# Altium project Main_board4.PrjPcb
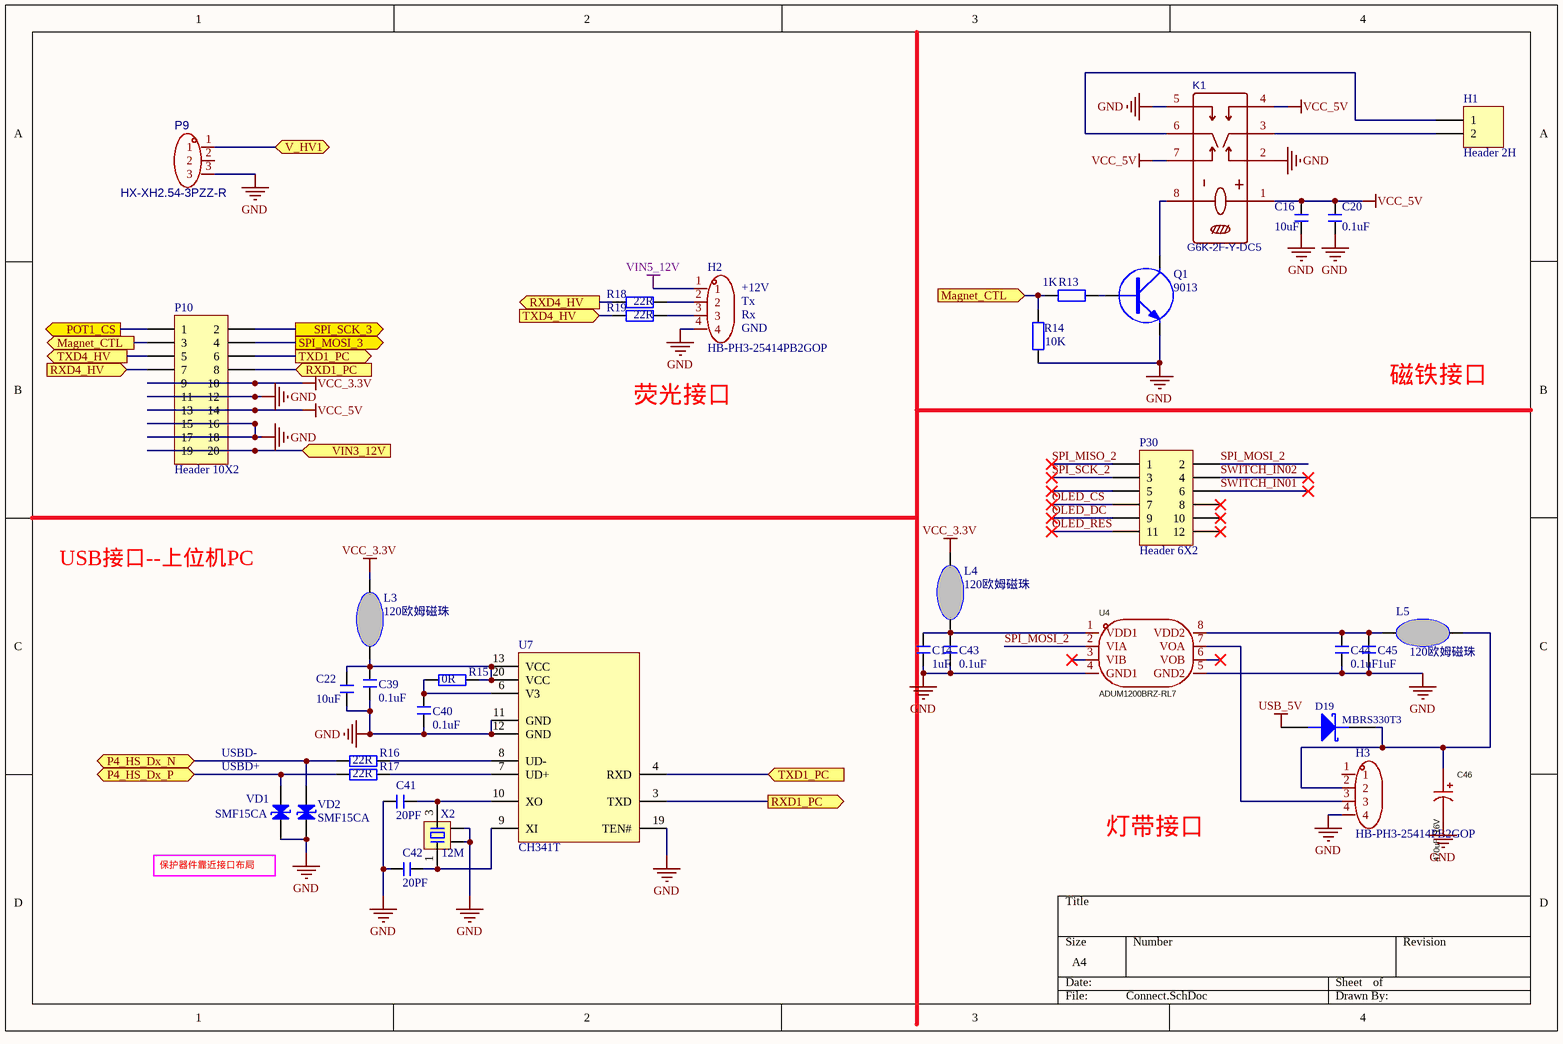
[diagram p0: Connect.SchDoc]
3 sheets, 176 parts. Net scope: flat (ports and power ports of the same name join across sheets).
Board file: BD4_dy_V1.0.PcbDoc
Sheets:
  Connect.SchDoc
  Power.SchDoc
  USBhub-CH634M-R0-1v1.SchDoc

## Sheet Connect.SchDoc
size A4

### Parts
(Parts that share a designator on the sheet are numbered #1, #2 ... from top to bottom, then left to right.)
C14  1uF  [C 0603]
C16#1  10uF  [C 0805]
C20#1  0.1uF  [C 0603]
C22#1  10uF  [C 0805]
C39  0.1uF  [C 0603]
C40  0.1uF  [C 0603]
C41  20PF  [C 0603]
C42  20PF  [C 0603]
C43  0.1uF  [C 0603]
C44  0.1uF  [C 0603]
C45  1uF  [C 0603]
C46  470uF /16V  [CAP-TH_BD8.0-P3.50-D0.6-FD]
D19  MBRS330T3  [MBRS340]
H1  Header 2H  [CONN-TH_2P-P2.54_ZX-XH2.54-2PZZ-Y]
H2  HB-PH3-25414PB2GOP  [CONN-TH_4P-P2.50_ZX-XH2.54-4PZZ-Y]
H3  HB-PH3-25414PB2GOP  [CONN-TH_4P-P2.50_ZX-XH2.54-4PZZ-Y]
K1  G6K-2F-Y-DC5  [RELAY-SMD_G6K-2F-Y]
L3  120欧姆磁珠  [L 0603]
L4  120欧姆磁珠  [L 0603]
L5  120欧姆磁珠  [L 0603]
P9  HX-XH2.54-3PZZ-R  [CONN-TH_3P-P2.50_HX-XH2.54-3PZZ-B]
P10  Header 10X2  [HDR-10X2]
P30  Header 6X2  [HDR-6X2]
Q1  9013  [SOT23]
R13  1K  [R 0603]
R14  10K  [R 0603]
R15  0R  [R 0603]
R16  22R  [R 0603]
R17  22R  [R 0603]
R18  22R  [R 0603]
R19  22R  [R 0603]
U4  ADUM1200BRZ-RL7  [SOIC-8_L4.9-W3.9-P1.27-LS6.0-BL]
U7  CH341T  [SSOP-20]
VD1  SMF15CA  [SOD-123F]
VD2  SMF15CA  [SOD-123F]
X2  12M  [XTAL-3225]

### Ports
Magnet_CTL (in), Magnet_CTL (out), P4_HS_Dx_N (bidir), P4_HS_Dx_P (bidir), POT1_CS (out), RXD1_PC (in), RXD1_PC (out), RXD4_HV (in), RXD4_HV (out), SPI_MOSI_3 (out), SPI_SCK_3 (out), TXD1_PC (in), TXD1_PC (out), TXD4_HV (in), TXD4_HV (out), V_HV1, VIN3_12V (in)

### Nets
GND: C14.2 C16#1.1 C20#1.1 C22#1.1 C39.1 C40.1 C41.2 C42.2 C43.2 C44.2 C45.2 C46.2 H2.4 H3.4 K1.2 K1.5 P9.3 P10.11 P10.12 P10.15 P10.16 P10.17 P10.18 Q1.2 R14.2 U4.4(GND1) U4.5(GND2) U7.11(GND) U7.12(GND) U7.19(TEN#) VD1.2(K) VD2.2(K) X2.2 X2.4
USB_5V: D19.1(A)
VCC_3.3V: L3.1 L4.1 P10.9 P10.10
VCC_5V: C16#1.2 C20#1.2 K1.1 K1.4 K1.7 P10.13 P10.14
VIN5_12V: H2.1
OLED_CS: P30.7
OLED_DC: P30.9
OLED_RES: P30.11
P4_AS_DX_N: R16.2 VD2.1(A) ; port P4_HS_Dx_N
P4_AS_DX_P: R17.2 VD1.1(A) ; port P4_HS_Dx_P
SPI_MISO_2: P30.1
SPI_MOSI_2: P30.2 U4.2(VIA)
SPI_SCK_2: P30.3
SWITCH_IN01: P30.6
SWITCH_IN02: P30.4
NetC14_1: C14.1 C43.1 L4.2 U4.1(VDD1)
NetC22#1_2: C22#1.2 C39.2 L3.2 R15.1 U7.13(VCC) U7.20(VCC)
NetC40_2: C40.2 R15.2 U7.6(V3)
NetC41_1: C41.1 U7.10(XO) X2.3
NetC42_1: C42.1 U7.9(XI) X2.1
NetC44_1: C44.1 C45.1 L5.1 U4.8(VDD2)
NetC46_1: C46.1 D19.2(K) H3.2 L5.2
NetC76_1: P9.1 ; port V_HV1
NetD8_1: P10.19 P10.20 ; port VIN3_12V
NetH1_1: H1.1 K1.6
NetH1_2: H1.2 K1.3
NetH2_2: H2.2 R18.1
NetH2_3: H2.3 R19.1
NetH3_3: H3.3 U4.7(VOA)
NetK1_8: K1.8 Q1.3
NetP10_1: P10.1 ; port POT1_CS
NetP10_2: P10.2 ; port SPI_SCK_3
NetP10_3: P10.3 R13.1 R14.1 ; port Magnet_CTL
NetP10_4: P10.4 ; port SPI_MOSI_3
NetP10_5: P10.5 R19.2 ; port TXD4_HV
NetP10_6: P10.6 U7.4(RXD) ; port TXD1_PC
NetP10_7: P10.7 R18.2 ; port RXD4_HV
NetP10_8: P10.8 U7.3(TXD) ; port RXD1_PC
NetQ1_1: Q1.1 R13.2
NetR16_1: R16.1 U7.8(UD-)
NetR17_1: R17.1 U7.7(UD+)

Not connected (* = marked no-connect by the designer): H3 1; P9 2; P30 5* 8* 10* 12*; U4 3(VIB)* 6(VOB)*

### Notes on the sheet
- (near H2) Tx
- (near H2) +12V
- (near H2) Rx
- (near H2) GND
- 磁铁接口
- 荧光接口
- USB接口--上位机PC
- USBD-
- USBD+
- 灯带接口
- 保护器件靠近接口布局
- (in symbol C-CAP) +

### Library data of the parts
C14 C16#1 C20#1 C43-C45 = C-CC: 直插瓷片电容; 版权归属: 源创客; BOM名称: 直插瓷片电容; 学习资源: www.ooocke.com
C22#1 C39-C42 = C: 无极性贴片电容; 版权归属: 源创客; BOM名称: 无极性贴片电容; 学习资源: www.ooocke.com
C46 = JBLE2471M016D090RLM 470UF 16V: Add into BOM: yes; Rated Voltage: 16V; Ripple Current: 3.7A@100kHz; Symbol: JBLE2471M016D090RLM 470UF 16V; Device: JBLE2471M016D090RLM 470UF 16V; Supplier Part: C19270650; Manufacturer Part: JBLE2471M016D090RLM 470UF 16V; JLCPCB Part Class: Extended Part; Datasheet: https://atta.szlcsc.com/upload/public/pdf/source/20240115/1E5B34C3EFC94403EAAAB66897201DA6.pdf; Supplier: LCSC; Convert to PCB: yes; Value: 470uF
D19 = DIODE SCHOTTKY: Schottky Diode
H1 = Header 2H: Header, 2-Pin, Right Angle; LatestRevisionDate: 17-Jul-2002; LatestRevisionNote: Re-released for DXP Platform.; Publisher: Altium Limited
H2 H3 = HB-PH3-25414PB2GOP: Add into BOM: yes; Pin Structure: 1x4P; Pitch: 2.54mm; Current Rating (Max): 3A; Voltage Rating (Max): 250V; Symbol: HB-PH3-25414PB2GOP; Device: HB-PH3-25414PB2GOP; Supplier Part: C6332197; Manufacturer Part: HB-PH3-25414PB2GOP; Datasheet: https://atta.szlcsc.com/upload/public/pdf/source/20230803/F72D259687963761DF1B552F3BB84A31.pdf; Supplier: LCSC; Convert to PCB: yes; Row Spacing: 2.54mm; Number of Pins: 4P; Length of Mating Pin: 6mm; Insulation Height: 2.54mm; Length of End Connection Pin: 3mm; Comment_1: HB-PH3-25414PB2GOP
K1 = G6K-2F-Y-DC12: BOM_Manufacturer: Omron Electronics; Contributor: LCSC; BOM_Supplier: LCSC; BOM_Supplier Part: C397194; BOM_Manufacturer Part: G6K-2F-Y-DC12; BOM_JLCPCB Part Class: Extended Part; spicePre: K; spiceSymbolName: G6K-2F-Y-DC12
L3-L5 = FERRITBEAD
P9 = HX-XH2.54-3PZZ-R: AddInBom: yes; Pins Structure: 1x3P; Pitch: 2.54mm; Reference Series: XH; Number of PINs Per Row: 3; Current Rating: 3A; Voltage Rating: 250V; Plastic Material: PA66; Flame Retardant Rating: UL94V-0; Symbol: HX-XH2.54-3PZZ-R; Device: HX-XH2.54-3PZZ-R; SupplierPart: C49010011; ManufacturerPart: HX-XH2.54-3PZZ-R; JLCPCB Part Class: Extended Part; Datasheet: https://item.szlcsc.com/datasheet/HX-XH2.54-3PZZ-R/51365932.html; Supplier: LCSC; ConvertToPcb: yes; FootprintName: CONN-TH_3P-P2.50_HX-XH2.54-3PZZ-B; Number of Pins: 3P; Number of Rows: 1; Row Spacing: -; Supplementary Features: -; Z-Height of the Board: -; X-Length of Bottom Edge on Board (Spacing Line): -; Y-Width of Bottom Edge on Board: -
P10 = Header 10X2: Header, 10-Pin, Dual row; LatestRevisionDate: 17-Jul-2002; LatestRevisionNote: Re-released for DXP Platform.; Publisher: Altium Limited
P30 = Header 6X2: Header, 6-Pin, Dual row; LatestRevisionDate: 17-Jul-2002; LatestRevisionNote: Re-released for DXP Platform.; Publisher: Altium Limited
Q1 = 2N2222: value: 9013
R13 R14 = Res2: Resistor; Published: 8-Jun-2000; LatestRevisionDate: 17-Jul-2002; LatestRevisionNote: Re-released for DXP Platform.; PackageReference: AXIAL-0.4; Publisher: Altium Limited
  R13: Value: 1K
  R14: Value: 10K
R15-R19 = R: 贴片电阻; 版权归属: 源创客; BOM名称: 贴片电阻; 学习资源: www.ooocke.com
U4 = ADUM1200BRZ-RL7: Add into BOM: yes; Number of Forward Channels: 2; Number of Reverse Channels: 0; Data Rate(Max): 25Mbps; Isolation Voltage(Vrms): 2500; CMTI(kV/us): 25kV/us; Symbol: ADUM1200BRZ; Device: ADUM1200BRZ-RL7; Supplier Part: C30230; Manufacturer Part: ADUM1200BRZ-RL7; Supplier Footprint: SOIC-8; JLCPCB Part Class: Extended Part; Datasheet: https://atta.szlcsc.com/upload/public/pdf/source/20140418/1457707045216.pdf; Supplier: LCSC; Convert to PCB: yes; Default Output: -; Rating: -; Comment_1: ADUM1200BRZ-RL7
VD1 VD2 = DR: 瞬态电压抑制二极管; 版权归属: 源创客; BOM名称: 瞬态电压抑制二极管; 学习资源: www.ooocke.com
X2 = XTAL-4: 4脚晶振; 版权归属: 源创客; BOM名称: 4脚晶振; 学习资源: www.ooocke.com

## Sheet Power.SchDoc
size A3
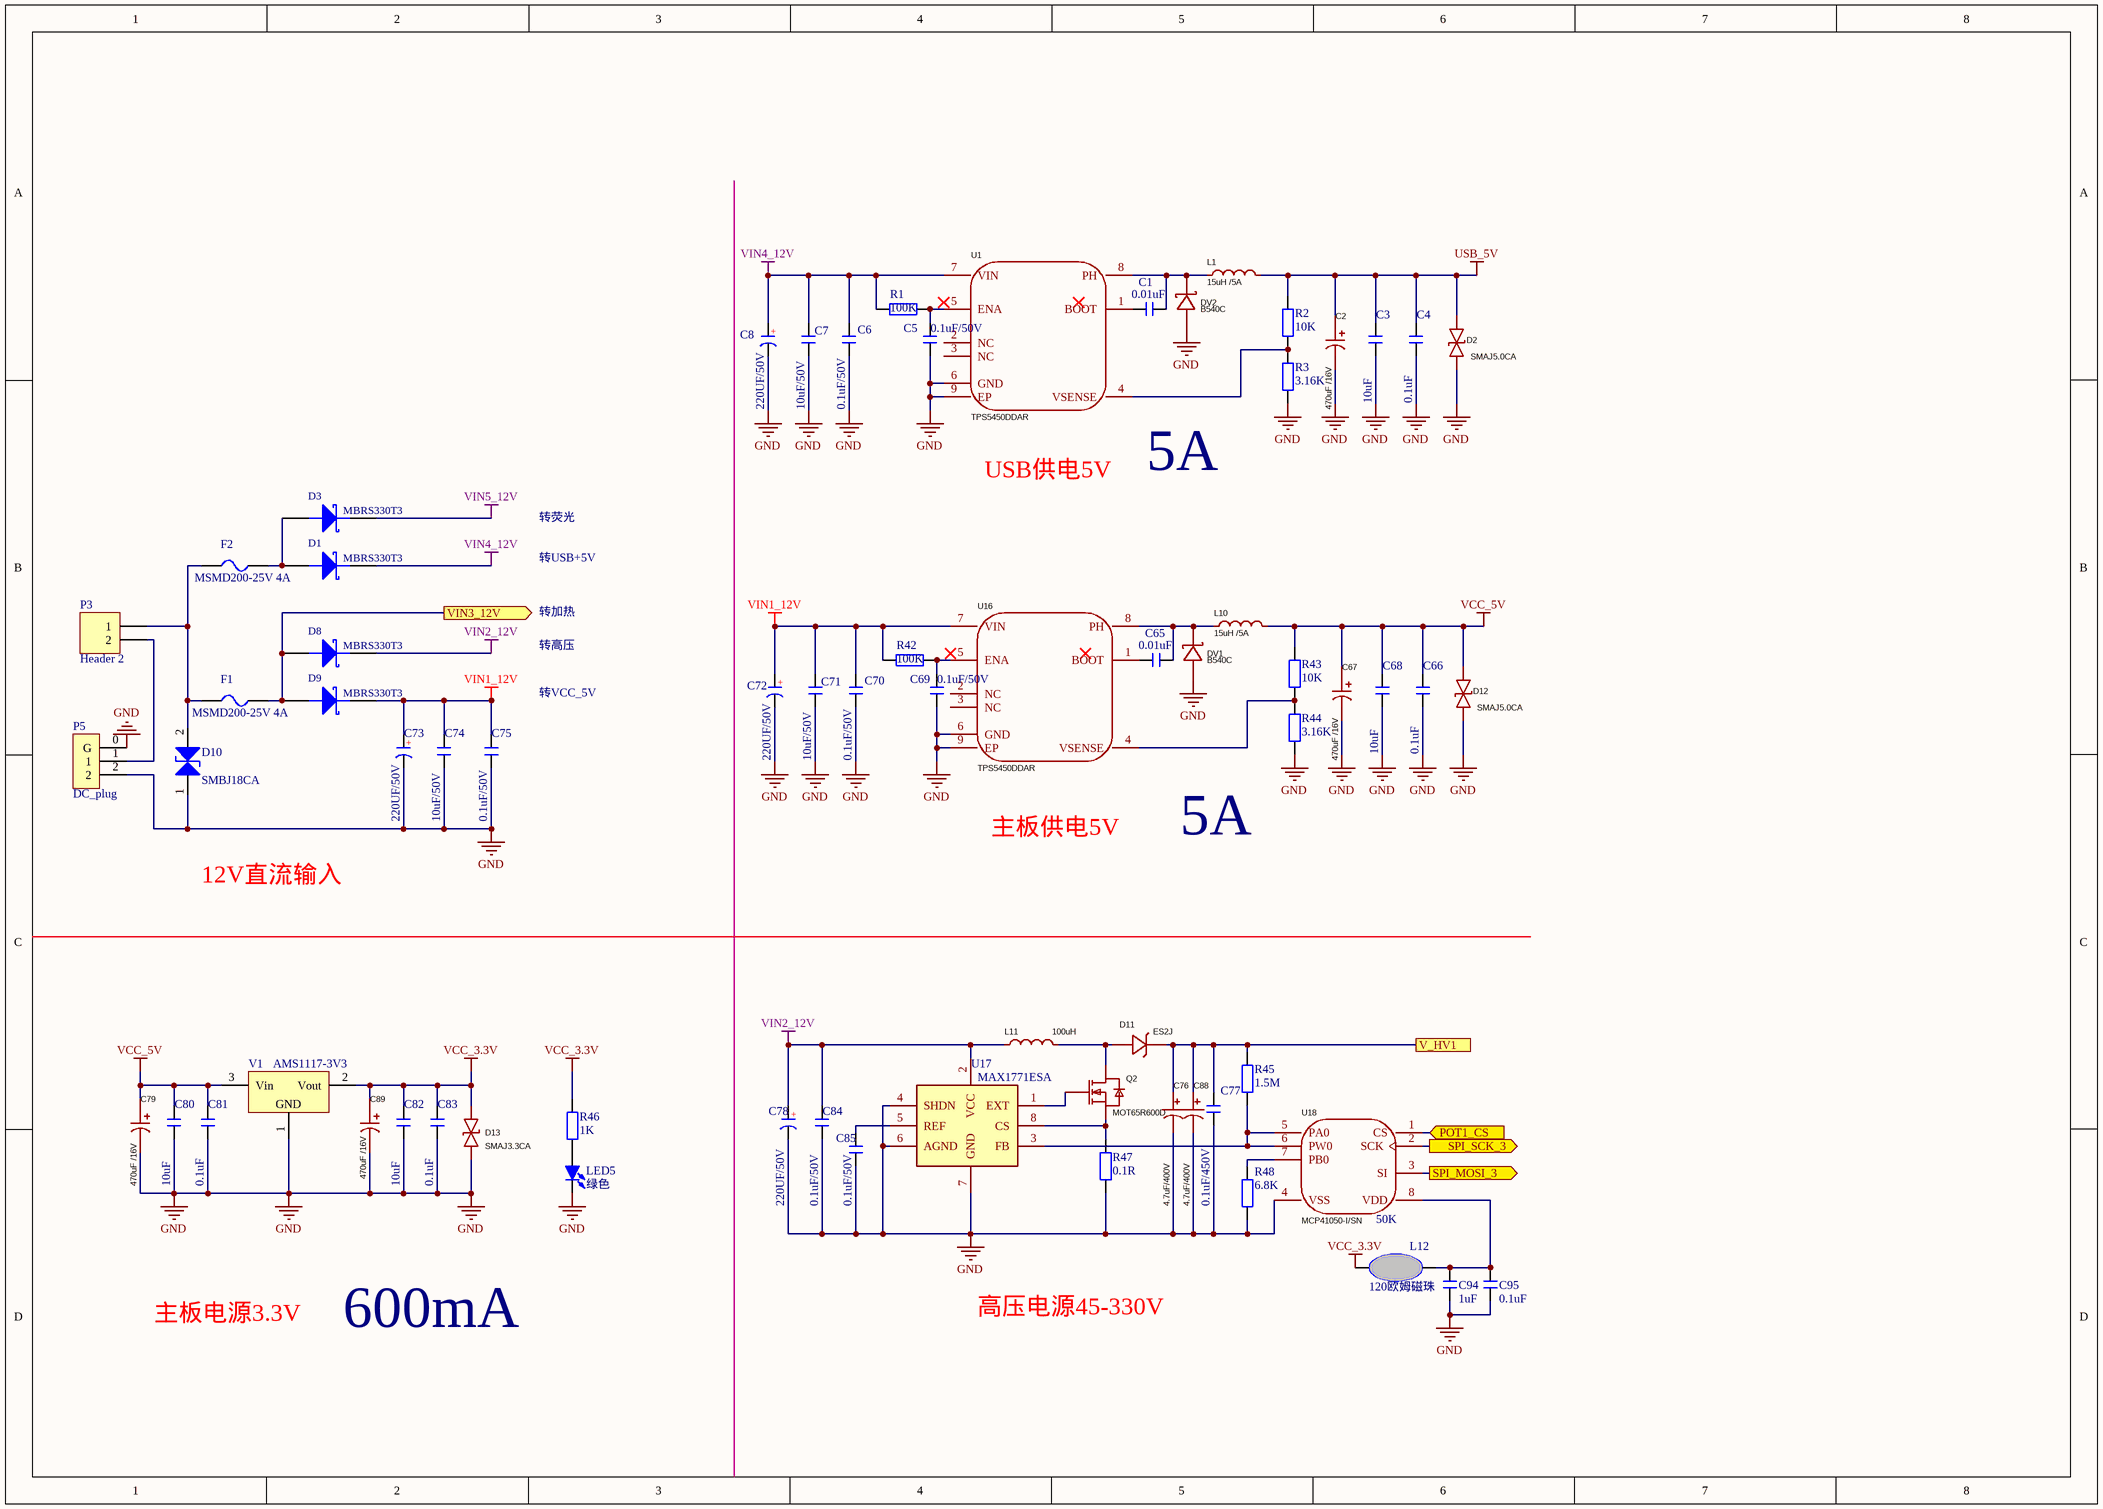
[diagram p1: Power.SchDoc]

### Parts
(Parts that share a designator on the sheet are numbered #1, #2 ... from top to bottom, then left to right.)
C1  0.01uF  [C 1206]
C2  470uF /16V  [CAP-TH_BD8.0-P3.50-D0.6-FD]
C3  10uF  [C 0805]
C4  0.1uF  [C 0603]
C5  0.1uF/50V  [C 1206]
C6  0.1uF/50V  [C 1206]
C7  10uF/50V  [C 1206]
C8  220UF/50V  [CAP 5.0*10*12.5]
C65  0.01uF  [C 1206]
C66  0.1uF  [C 0603]
C67  470uF /16V  [CAP-TH_BD8.0-P3.50-D0.6-FD]
C68  10uF  [C 0805]
C69  0.1uF/50V  [C 1206]
C70  0.1uF/50V  [C 1206]
C71  10uF/50V  [C 1206]
C72  220UF/50V  [CAP 5.0*10*12.5]
C73  220UF/50V  [CAP 5.0*10*12.5]
C74  10uF/50V  [C 1206]
C75  0.1uF/50V  [C 1206]
C76  4.7uF/400V  [CAP-TH_BD8.0-P3.50-D0.6-FD]
C77  0.1uF/450V  [C 1206]
C78  220UF/50V  [CAP 5.0*10*12.5]
C79  470uF /16V  [CAP-TH_BD8.0-P3.50-D0.6-FD]
C80  10uF  [C 0805]
C81  0.1uF  [C 0603]
C82  10uF  [C 0805]
C83  0.1uF  [C 0603]
C84  0.1uF/50V  [C 1206]
C85  0.1uF/50V  [C 1206]
C88  4.7uF/400V  [CAP-TH_BD8.0-P3.50-D0.6-FD]
C89  470uF /16V  [CAP-TH_BD8.0-P3.50-D0.6-FD]
C94  1uF  [C 0603]
C95  0.1uF  [C 0603]
D1  MBRS330T3  [MBRS340]
D2  SMAJ5.0CA  [SMA_L4.4-W2.6-LS5.0-BI]
D3  MBRS330T3  [MBRS340]
D8  MBRS330T3  [MBRS340]
D9  MBRS330T3  [MBRS340]
D10  SMBJ18CA  [SMB]
D11  ES2J  [SMB_L4.4-W3.6-LS5.4-RD]
D12  SMAJ5.0CA  [SMA_L4.4-W2.6-LS5.0-BI]
D13  SMAJ3.3CA  [SMA_L4.4-W2.6-LS5.0-BI]
DV1  B540C  [SMC_L7.1-W6.2-LS8.1-RD]
DV2  B540C  [SMC_L7.1-W6.2-LS8.1-RD]
F1  MSMD200-25V 4A  [FU 1812]
F2  MSMD200-25V 4A  [FU 1812]
L1  15uH /5A  [IND-SMD_L8.5-W8.0_PCC-M0854M]
L10  15uH /5A  [IND-SMD_L8.5-W8.0_PCC-M0854M]
L11  100uH  [IND-SMD_L18.3-W17.0]
L12  120欧姆磁珠  [L 0603]
LED5  绿色  [LED 0603G]
P3#1  Header 2  [SIP2-3.5mm]
P5  DC_plug  [POWERPLUG_slc]
Q2  MOT65R600D  [TO-252-3_L6.6-W6.1-P4.58-LS10.1-BR-1]
R1  100K  [R 0603]
R2#1  10K  [R 0603]
R3#1  3.16K  [R 0603]
R42  100K  [R 0603]
R43  10K  [R 0603]
R44  3.16K  [R 0603]
R45  1.5M  [RES-TH_BD2.4-L6.3-P10.30-D0.6]
R46  1K  [R 0603]
R47  0.1R  [R 1812]
R48  6.8K  [R 0603]
U1  TPS5450DDAR  [SOP-8_L4.9-W3.9-P1.27-LS6.0-BL-EP]
U16  TPS5450DDAR  [SOP-8_L4.9-W3.9-P1.27-LS6.0-BL-EP]
U17  MAX1771ESA  [SOP8_N]
U18  MCP41050-I/SN  [SOIC-8_L4.9-W3.9-P1.27-LS6.0-BL]
V1  AMS1117-3V3  [SOT223_M]

### Ports
POT1_CS (in), SPI_MOSI_3 (out), SPI_SCK_3 (out), V_HV1, VIN3_12V (out)

### Nets
GND: C2.2 C3.1 C4.1 C5.1 C6.1 C7.1 C8.2 C66.1 C67.2 C68.1 C69.1 C70.1 C71.1 C72.2 C73.2 C74.1 C75.1 C76.2 C77.1 C78.2 C79.2 C80.1 C81.1 C82.1 C83.1 C84.1 C85.1 C88.2 C89.2 C94.2 C95.2 D2.1 D10.1(A) D12.1 D13.1 DV1.2(A) DV2.2(A) LED5.2(K) P5.0(G) P5.2 R3#1.2 R44.2 R47.2 R48.2 U1.6(GND) U1.9(EP) U16.6(GND) U16.9(EP) U17.4(SHDN) U17.6(AGND) U17.7(GND) U18.4(VSS) V1.1(GND)
USB_5V: C2.1 C3.2 C4.2 D2.2 L1.2 R2#1.1
VCC_3.3V: C82.2 C83.2 C89.1 D13.2 L12.1 R46.2 V1.2(Vout)
VCC_5V: C66.2 C67.1 C68.2 C79.1 C80.2 C81.2 D12.2 L10.2 R43.1 V1.3(Vin)
VIN1_12V: C70.2 C71.2 C72.1 C73.1 C74.2 C75.2 D9.2(K) R42.2 U16.7(VIN)
VIN2_12V: C78.1 C84.2 D8.2(K) L11.1 U17.2(VCC)
VIN4_12V: C6.2 C7.2 C8.1 D1.2(K) R1.2 U1.7(VIN)
VIN5_12V: D3.2(K)
NetC1_1: C1.1 DV2.1(K) L1.1 U1.8(PH)
NetC1_2: C1.2 U1.1(BOOT)
NetC5_2: C5.2 R1.1 U1.5(ENA)
NetC65_1: C65.1 DV1.1(K) L10.1 U16.8(PH)
NetC65_2: C65.2 U16.1(BOOT)
NetC69_2: C69.2 R42.1 U16.5(ENA)
NetC76_1: C76.1 C77.2 C88.1 D11.1(C) R45.1 ; port V_HV1
NetC85_2: C85.2 U17.5(REF)
NetC94_1: C94.1 C95.1 L12.2 U18.8(VDD)
NetD1_1: D1.1(A) D3.1(A) F2.2
NetD8_1: D8.1(A) D9.1(A) F1.2 ; port VIN3_12V
NetD10_2: D10.2(K) F1.1 F2.1 P3#1.1
NetD11_2: D11.2(A) L11.2 Q2.2(D)
NetLED5_1: LED5.1(A) R46.1
NetP3#1_2: P3#1.2 P5.1
NetP10_1: U18.1(CS) ; port POT1_CS
NetP10_2: U18.2(SCK) ; port SPI_SCK_3
NetP10_4: U18.3(SI) ; port SPI_MOSI_3
NetQ2_1: Q2.1(G) U17.1(EXT)
NetQ2_3: Q2.3(S) R47.1 U17.8(CS)
NetR2#1_2: R2#1.2 R3#1.1 U1.4(VSENSE)
NetR43_2: R43.2 R44.1 U16.4(VSENSE)
NetR45_2: R45.2 U17.3(FB) U18.5(PA0) U18.6(PW0)
NetR48_1: R48.1 U18.7(PB0)

Not connected (* = marked no-connect by the designer): U1 2(NC) 3(NC); U16 2(NC) 3(NC)

### Notes on the sheet
- USB供电5V
- (near U1) 5A
- 转USB+5V
- 转荧光
- 转高压
- 转加热
- 转VCC_5V
- 主板供电5V
- 5A
- 12V直流输入
- (near U18) 50K
- 主板电源3.3V
- 高压电源45-330V
- 600mA
- (in symbol C-CAP) +

### Library data of the parts
C1 C3-C7 C65 C66 C68-C71 C74 C75 C77 C80 C84 C85 = C: 无极性贴片电容; 版权归属: 源创客; BOM名称: 无极性贴片电容; 学习资源: www.ooocke.com
C2 C67 C79 C89 = JBLE2471M016D090RLM 470UF 16V: as C46 on sheet Connect; Symbol: JBLE2471M016D090RLM 470UF 16V; Device: JBLE2471M016D090RLM 470UF 16V; Supplier Part: C19270650; Manufacturer Part: JBLE2471M016D090RLM 470UF 16V; JLCPCB Part Class: Extended Part; Datasheet: https://atta.szlcsc.com/upload/public/pdf/source/20240115/1E5B34C3EFC94403EAAAB66897201DA6.pdf; Supplier: LCSC; Convert to PCB: yes; Value: 470uF
C8 C72 C73 C78 = C-CAP: 直插电解电容; 版权归属: 源创客; BOM名称: 直插电解电容; 学习资源: www.ooocke.com
C76 C88 = ERK2GM4R7F09OT: Add into BOM: yes; Value: 4.7uF; Rated Voltage: 400V; Ripple Current: 94mA@100kHz; L: 9mm; Symbol: ERK2GM4R7F09OT; Device: ERK2GM4R7F09OT; Supplier Part: C112499; Manufacturer Part: ERK2GM4R7F09OT; JLCPCB Part Class: Extended Part; Datasheet: https://atta.szlcsc.com/upload/public/pdf/source/20200117/C486002_277F2A16EBB2F90C92EEA28887F58F34.pdf; Supplier: LCSC; Convert to PCB: yes; Equivalent Series Resistance(ESR): -; Lead Spacing: 3.5mm
C81-C83 C94 C95 = C-CC: 直插瓷片电容; 版权归属: 源创客; BOM名称: 直插瓷片电容; 学习资源: www.ooocke.com
D1 D3 D8 D9 = DIODE SCHOTTKY: Schottky Diode
D2 D12 = SMAJ5.0CA_C83324: Symbol: SMAJ5.0CA-C83324; Add into BOM: yes; Reverse Stand-Off Voltage (Vrwm): 5V; Maximum Clamping Voltage: 9.2V; Peak Pulse Current (Ipp)@10/1000us: 43.5A; Peak Pulse Power Dissipation (Ppp)@10/1000us: 400W; Breakdown Voltage: 6.4V; Type: TVS; Device: SMAJ5.0CA_C83324; Supplier Part: C83324; Manufacturer Part: SMAJ5.0CA; Supplier Footprint: SMA(DO-214AC); JLCPCB Part Class: Extended Part; Datasheet: https://atta.szlcsc.com/upload/public/pdf/source/20190402/C374025_5ACE77BC72947DF13CF0CBC7F8B57228.pdf; Supplier: LCSC; Convert to PCB: yes
D10 = 1.04.03.0004: SMBJ36CA,DO-214AA,君耀,RoHS; 名称: TVS管; 贴片和直插: SMT; 器件优选方案: 样品物料,谨慎选用; 物料代码: 1.04.03.0004; Value: SMBJ36CA; 封装: SMB; 设备封装名称: SMB; 厂商: 君耀; RoHS: RoHS; 型号: SMBJ18CA; ComponentLink1Description: ErpDataInfo; ComponentLink1URL: http://erp.zlgmcu.com/ErpExt/ErpData/ListMateriel.aspx?pkey=1.04.03.0004
D11 = ES2J_C19078414: Add into BOM: yes; Forward Voltage (Vf@If): 1.65V@2A; Reverse Voltage (Vr): 600V; Rectified Current: 2A; Reverse Leakage Current (Ir): 5uA@600V; Reverse Recovery Time (trr): 35ns; Symbol: ES2J_C19078414; Device: ES2J_C19078414; LCSC Part Name: ES2J; Supplier Part: C19078414; Manufacturer Part: ES2J; Supplier Footprint: SMB; JLCPCB Part Class: Extended Part; Datasheet: https://atta.szlcsc.com/upload/public/pdf/source/20240112/F384E3D3354022DF52BCF808895A4B58.pdf; Supplier: LCSC; Convert to PCB: yes
D13 = SMAJ3.3CA_C2959732: Add into BOM: yes; Reverse Stand-Off Voltage (Vrwm): 3.3V; Maximum Clamping Voltage: 7.3V; Peak Pulse Current (Ipp)@10/1000us: 54.8A; Breakdown Voltage: 4.3V; Reverse Leakage Current (Ir): 200uA; Type: TVS; Symbol: SMAJ3.3CA_C2959732; Device: SMAJ3.3CA_C2959732; Supplier Part: C2959732; Manufacturer Part: SMAJ3.3CA; Supplier Footprint: DO-214AC(SMA); JLCPCB Part Class: Extended Part; Datasheet: https://atta.szlcsc.com/upload/public/pdf/source/20240321/7565B800065238EC693350450D0B602E.pdf; Supplier: LCSC; Convert to PCB: yes
DV1 DV2 = B540C-13-F: Add into BOM: yes; Forward Voltage (Vf@If): 550mV@5A; Reverse Voltage (Vr): 40V; Average Rectified Current (Io): 5A; Reverse Leakage Current (Ir): 500uA@40V; Symbol: B540C-13-F; Device: B540C-13-F; Supplier Part: C72264; Manufacturer Part: B540C-13-F; Supplier Footprint: SMC(DO-214AB); JLCPCB Part Class: Extended Part; Datasheet: https://atta.szlcsc.com/upload/public/pdf/source/20171023/C134461_15087453602301052556.pdf; Supplier: LCSC; Convert to PCB: yes
F1 F2 = FU: 贴片保险丝; 版权归属: 源创客; BOM名称: 贴片保险丝; 学习资源: www.ooocke.com
L1 L10 = PSPMAA0805-150M-ANP: Add into BOM: yes; Rated Current: 5A; Saturation Current (Isat): 9A; Symbol: PSPMAA0805-150M-ANP; Device: PSPMAA0805-150M-ANP; Supplier Part: C2962886; Manufacturer Part: PSPMAA0805-150M-ANP; Supplier Footprint: SMD,8x8.5mm; JLCPCB Part Class: Extended Part; Datasheet: https://atta.szlcsc.com/upload/public/pdf/source/20220120/BD7CDDF36FF1CD7AF8FF4A475B57DD20.pdf; Supplier: LCSC; Convert to PCB: yes; Value: 15uH; Ratings: AEC-Q200
L11 = YSPIA1770-101M: Add into BOM: yes; Rated Current: 3.5A; Saturation Current (Isat): 5A; Symbol: YSPIA1770-101M; Device: YSPIA1770-101M; Supplier Part: C2931812; Manufacturer Part: YSPIA1770-101M; Supplier Footprint: SMD,18.25x17mmx7mm; JLCPCB Part Class: Extended Part; Datasheet: https://atta.szlcsc.com/upload/public/pdf/source/20210615/C2839932_33EF3FE61893DB0D450802CD7C52B644.pdf; Supplier: LCSC; Convert to PCB: yes; Value: 100uH; Ratings: -
L12 = FERRITBEAD
LED5 = LED-SMD: 贴片LED; 版权归属: 源创客; BOM名称: 贴片LED; 学习资源: www.ooocke.com
P3#1 = Header 2: Header, 2-Pin; LatestRevisionDate: 17-Jul-2002; LatestRevisionNote: Re-released for DXP Platform.; Publisher: Altium Limited
Q2 = MOT65R600D: Add into BOM: yes; Drain Source Voltage (Vdss): 650V; Continuous Drain Current (Id): 7A; Power Dissipation (Pd): 63W; Gate Threshold Voltage (Vgs(th)@Id): 2.5V@250uA; Total Gate Charge (Qg@Vgs): 13nC@10V; Input Capacitance (Ciss@Vds): 509pF@100V; Reverse Transfer Capacitance (Crss@Vds): 1.5pF@100V; Symbol: MOT65R600D; Device: MOT65R600D; Supplier Part: C5143201; Manufacturer Part: MOT65R600D; Supplier Footprint: TO-252; JLCPCB Part Class: Extended Part; Datasheet: https://atta.szlcsc.com/upload/public/pdf/source/20231226/F31B09EB8E73CB4CBA914FBE4A0ABFD1.pdf; Supplier: LCSC; Convert to PCB: yes
R1 R2#1 R3#1 R42-R48 = R: 贴片电阻; 版权归属: 源创客; BOM名称: 贴片电阻; 学习资源: www.ooocke.com
U1 U16 = TPS5450DDAR: Add into BOM: yes; Input Voltage: 5.5V~36V; Output Voltage: 1.221V~31.32V; Output Current: 5A; Switching Frequency: 500kHz; Number of Outputs: 1; Symbol: TPS5450DDAR; Device: TPS5450DDAR; Supplier Part: C114425; Manufacturer Part: TPS5450DDAR; Supplier Footprint: SOP-8-EP-150mil; JLCPCB Part Class: Extended Part; Datasheet: https://www.ti.com/cn/lit/gpn/tps5450; Supplier: LCSC; Convert to PCB: yes
U18 = MCP41050-I/SN: Add into BOM: yes; Number of Taps: 256; Number of Channels: 1; Supply Voltage: 2.7V~5.5V; Interface Type: SPI; Symbol: MCP41050-I/SN; Device: MCP41050-I/SN; LCSC Part Name: MCP41050-I/SN; Supplier Part: C124138; Manufacturer Part: MCP41050-I/SN; Supplier Footprint: SOIC-8; JLCPCB Part Class: Extended Part; Datasheet: https://atta.szlcsc.com/upload/public/pdf/source/20220205/C2666606_C5E8E7A5F3891B321C1555D845654E7B.pdf; Supplier: LCSC; Convert to PCB: yes
V1 = AMS1117: 三端稳压芯片; BOM名称: 稳压芯片; 版权归属: 源创客; 学习资源: www.ooocke.com

## Sheet USBhub-CH634M-R0-1v1.SchDoc
size A3
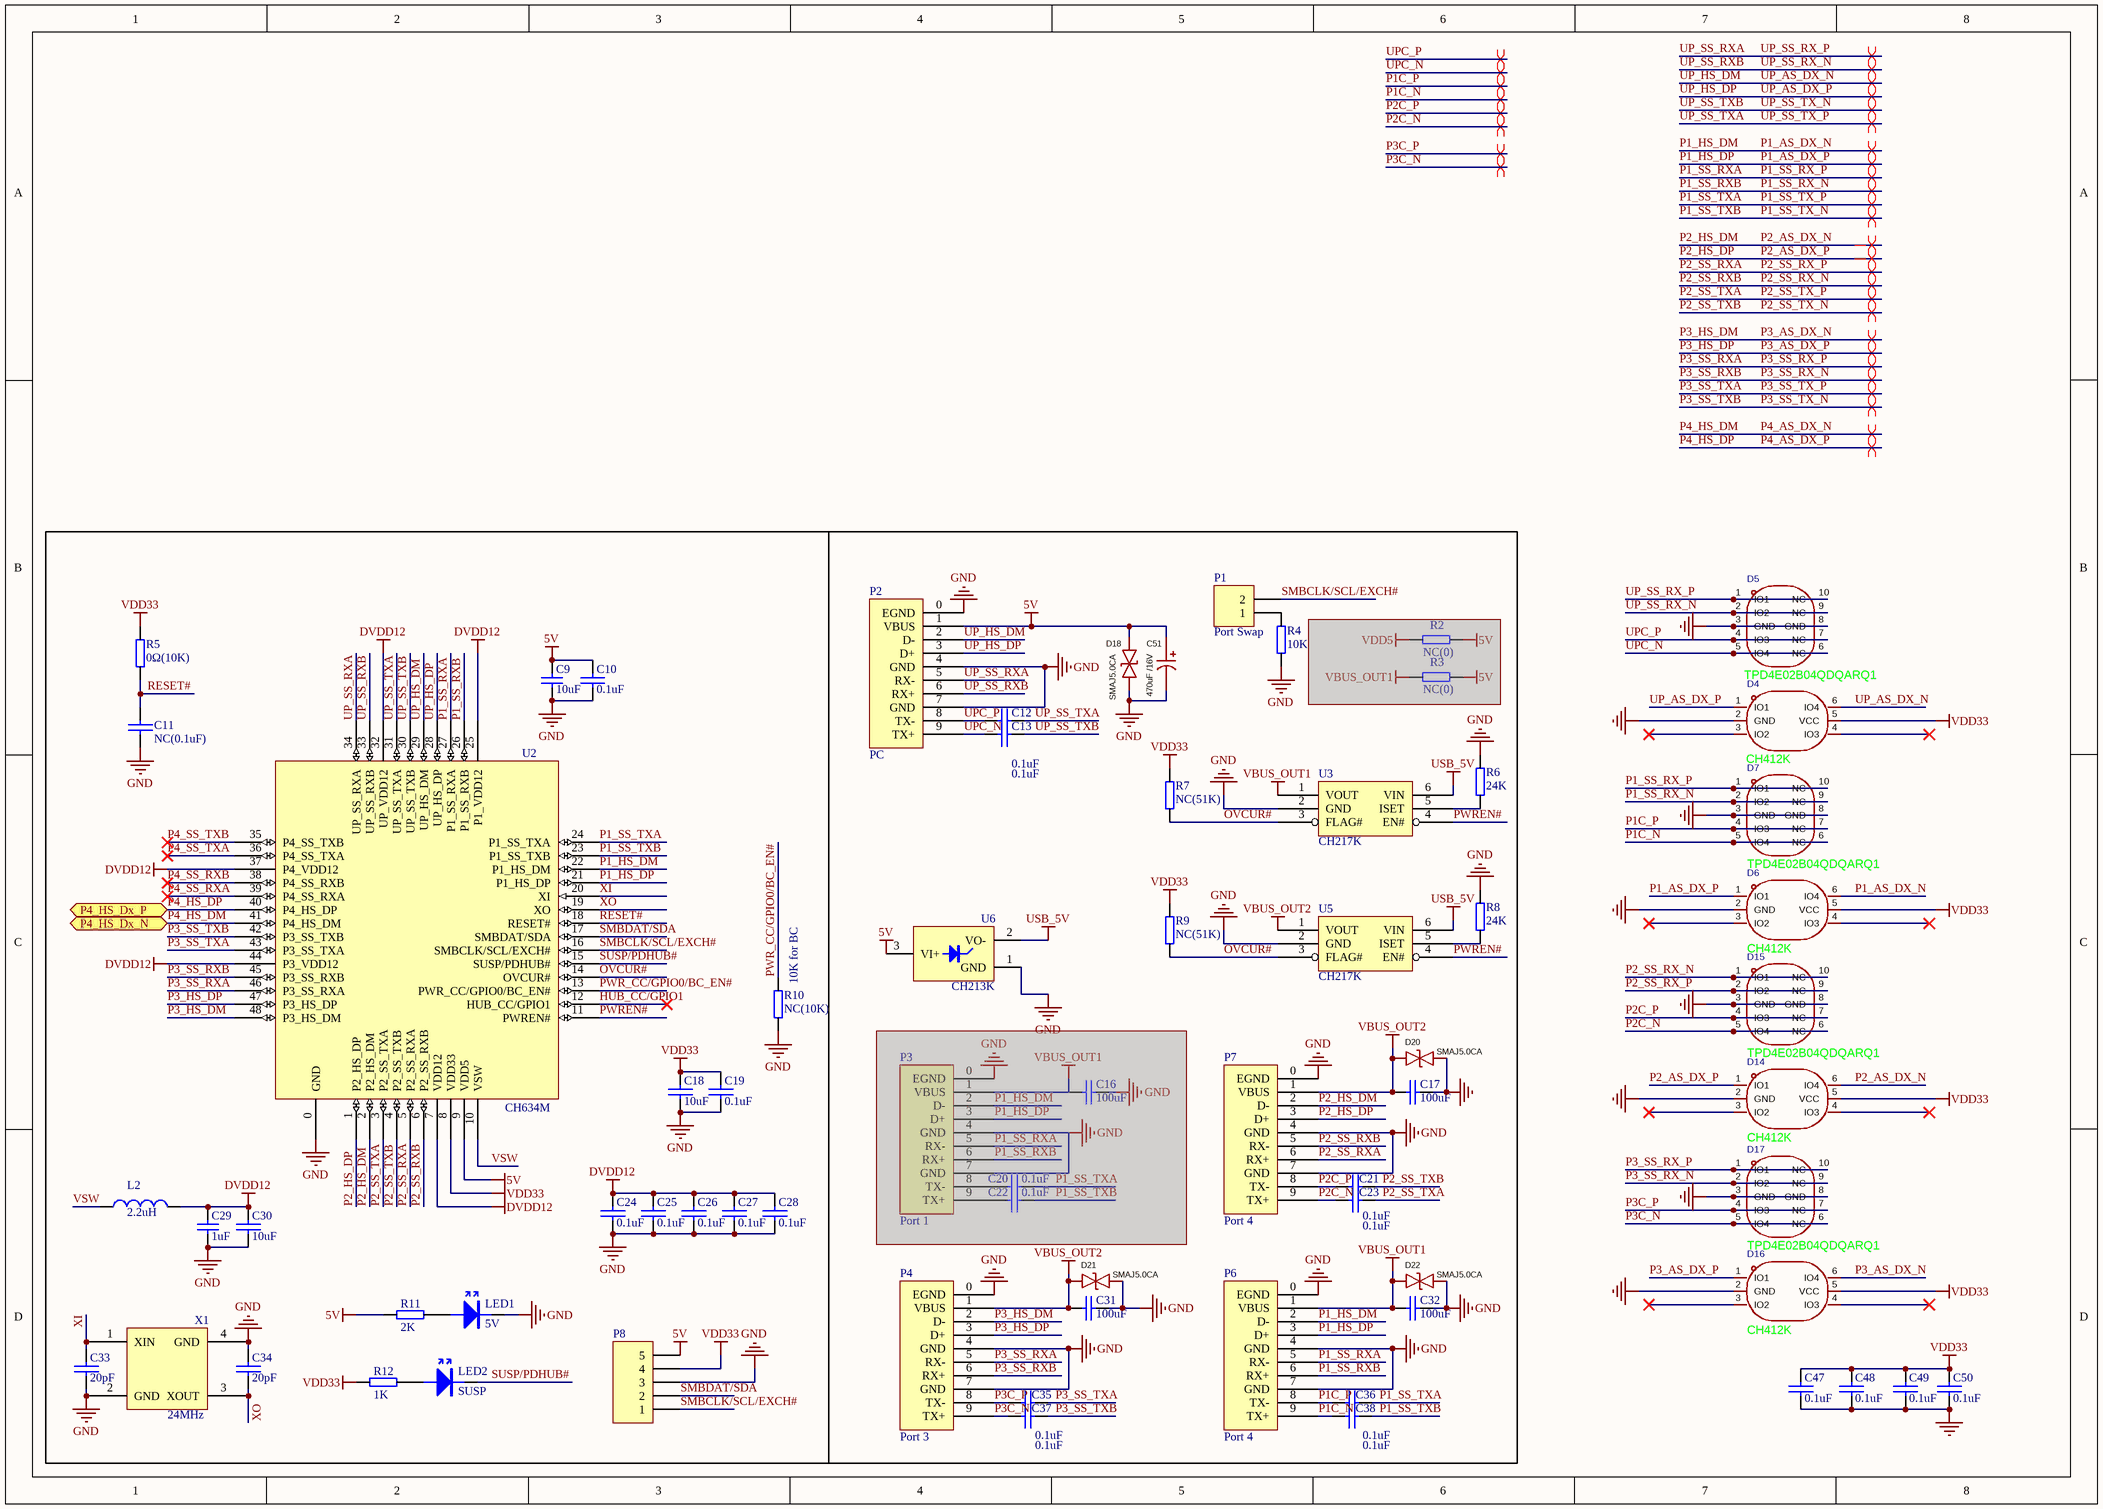
[diagram p2: USBhub-CH634M-R0-1v1.SchDoc]

### Parts
(Parts that share a designator on the sheet are numbered #1, #2 ... from top to bottom, then left to right.)
C9  10uF  [0603_C]
C10  0.1uF  [0402_C]
C11  NC(0.1uF)  [0402_C]
C12  0.1uF  [0402_C]
C13  0.1uF  [0402_C]
C16#2  100uF  [CD0.1]  (masked out: inside a compile mask, not in the netlist)
C17  100uF  [CD0.1]
C18  10uF  [0603_C]
C19  0.1uF  [0402_C]
C20#2  0.1uF  [0402_C]  (masked out: inside a compile mask, not in the netlist)
C21  0.1uF  [0402_C]
C22#2  0.1uF  [0402_C]  (masked out: inside a compile mask, not in the netlist)
C23  0.1uF  [0402_C]
C24  0.1uF  [0402_C]
C25  0.1uF  [0402_C]
C26  0.1uF  [0402_C]
C27  0.1uF  [0402_C]
C28  0.1uF  [0402_C]
C29  1uF  [0402_C]
C30  10uF  [0603_C]
C31  100uF  [CD0.1]
C32  100uF  [CD0.1]
C33  20pF  [0402_C]
C34  20pF  [0402_C]
C35  0.1uF  [0402_C]
C36  0.1uF  [0402_C]
C37  0.1uF  [0402_C]
C38  0.1uF  [0402_C]
C47  0.1uF  [0402_C]
C48  0.1uF  [0402_C]
C49  0.1uF  [0402_C]
C50  0.1uF  [0402_C]
C51  470uF /16V  [CAP-TH_BD8.0-P3.50-D0.6-FD]
D4  CH412K  [SOT-363_L2.0-W1.3-P0.65-LS2.1-BR]
D5  TPD4E02B04QDQARQ1  [USON-10_L2.5-W1.0-P0.50-BL]
D6  CH412K  [SOT-363_L2.0-W1.3-P0.65-LS2.1-BR]
D7  TPD4E02B04QDQARQ1  [USON-10_L2.5-W1.0-P0.50-BL]
D14  CH412K  [SOT-363_L2.0-W1.3-P0.65-LS2.1-BR]
D15  TPD4E02B04QDQARQ1  [USON-10_L2.5-W1.0-P0.50-BL]
D16  CH412K  [SOT-363_L2.0-W1.3-P0.65-LS2.1-BR]
D17  TPD4E02B04QDQARQ1  [USON-10_L2.5-W1.0-P0.50-BL]
D18  SMAJ5.0CA  [SMA_L4.4-W2.6-LS5.0-BI]
D20  SMAJ5.0CA  [SMA_L4.4-W2.6-LS5.0-BI]
D21  SMAJ5.0CA  [SMA_L4.4-W2.6-LS5.0-BI]
D22  SMAJ5.0CA  [SMA_L4.4-W2.6-LS5.0-BI]
L2  2.2uH  [CD32]
LED1  5V  [0603+]
LED2  SUSP  [0603+]
P1  Port Swap  [SIP2-2.54mm]
P2  PC  [USB3.0-A-Receptacle]
P3#2  Port 1  [USB3.0-A-Receptacle]  (masked out: inside a compile mask, not in the netlist)
P4  Port 3  [USB3.0-A-Receptacle]
P6  Port 4  [USB3.0-A-Receptacle]
P7  Port 4  [USB3.0-A-Receptacle]
P8  (no value)  [SIP5-2.54mm]
R2#2  NC(0)  [0402]  (masked out: inside a compile mask, not in the netlist)
R3#2  NC(0)  [0402]  (masked out: inside a compile mask, not in the netlist)
R4  10K  [0402]
R5  0Ω(10K)  [0402]
R6  24K  [0402]
R7  NC(51K)  [0402]
R8  24K  [0402]
R9  NC(51K)  [0402]
R10  NC(10K)  [0402]
R11  2K  [0402]
R12  1K  [0402]
U2  CH634M  [QFN48_5X5]
U3  CH217K  [SOT-23-6]
U5  CH217K  [SOT-23-6]
U6  CH213K  [SOT-23-3]
X1  24MHz  [XT3225]

### Blocks framed on the sheet
10K for BC: C9-C13 C16#2 C17-C19 C20#2 C21 C22#2 C23-C38 C51 D18 D20-D22 L2 LED1 LED2 P1 P2 P3#2 P4 P6-P8 R2#2 R3#2 R4-R12 U2 U3 U5 U6 X1

### Ports
P4_HS_Dx_N (bidir), P4_HS_Dx_P (bidir)

### Nets
5V: C9.2 C10.2 C51.1 D18.2 P2.1(VBUS) P8.5 R11.2 U2.9(VDD5) U6.3(VI+)
DVDD12: C24.2 C25.2 C26.2 C27.2 C28.2 C29.2 C30.1 L2.2 U2.7(VDD12) U2.25(P1_VDD12) U2.32(UP_VDD12) U2.37(P4_VDD12) U2.44(P3_VDD12)
GND: C9.1 C10.1 C11.1 C17.2 C18.2 C19.1 C24.1 C25.1 C26.1 C27.1 C28.1 C29.1 C30.2 C31.2 C32.2 C33.2 C34.1 C47.1 C48.1 C49.1 C50.1 C51.2 D4.2(GND) D5.3(GND) D5.8(GND) D6.2(GND) D7.3(GND) D7.8(GND) D14.2(GND) D15.3(GND) D15.8(GND) D16.2(GND) D17.3(GND) D17.8(GND) D18.1 D20.1 D21.1 D22.1 LED1.2(K) P2.0(EGND) P2.4(GND) P2.7(GND) P4.0(EGND) P4.4(GND) P4.7(GND) P6.0(EGND) P6.4(GND) P6.7(GND) P7.0(EGND) P7.4(GND) P7.7(GND) P8.3 R4.2 R6.2 R8.2 R10.1 U2.0(GND) U3.2(GND) U5.2(GND) U6.1(GND) X1.2(GND) X1.4(GND)
USB_5V: U3.6(VIN) U5.6(VIN) U6.2(VO-)
VBUS_OUT1: C32.1 D22.2 P6.1(VBUS) U3.1(VOUT)
VBUS_OUT2: C17.1 C31.1 D20.2 D21.2 P4.1(VBUS) P7.1(VBUS) U5.1(VOUT)
VDD33: C18.1 C19.2 C47.2 C48.2 C49.2 C50.2 D4.5(VCC) D6.5(VCC) D14.5(VCC) D16.5(VCC) P8.4 R5.2 R7.1 R9.1 R12.2 U2.8(VDD33)
HUB_CC/GPIO1: U2.12(HUB_CC/GPIO1)
OVCUR#: R7.2 R9.2 U2.14(OVCUR#) U3.3(FLAG#) U5.3(FLAG#)
P1_AS_DX_N: D6.6(IO4) P6.2(D-) U2.22(P1_HS_DM)  [also labelled P1_HS_DM]
P1_AS_DX_P: D6.1(IO1) P6.3(D+) U2.21(P1_HS_DP)  [also labelled P1_HS_DP]
P1_SS_RX_N: D7.2(IO2) D7.9(NC) P6.6(RX+) U2.26(P1_SS_RXB)  [also labelled P1_SS_RXB]
P1_SS_RX_P: D7.1(IO1) D7.10(NC) P6.5(RX-) U2.27(P1_SS_RXA)  [also labelled P1_SS_RXA]
P1_SS_TX_N: C38.2 U2.23(P1_SS_TXB)  [also labelled P1_SS_TXB]
P1_SS_TX_P: C36.2 U2.24(P1_SS_TXA)  [also labelled P1_SS_TXA]
P1C_N: C38.1 D7.5(IO4) D7.6(NC) P6.9(TX+)
P1C_P: C36.1 D7.4(IO3) D7.7(NC) P6.8(TX-)
P2_AS_DX_N: D14.6(IO4) P7.2(D-) U2.2(P2_HS_DM)  [also labelled P2_HS_DM]
P2_AS_DX_P: D14.1(IO1) P7.3(D+) U2.1(P2_HS_DP)  [also labelled P2_HS_DP]
P2_SS_RX_N: D15.1(IO1) D15.10(NC) P7.5(RX-) U2.6(P2_SS_RXB)  [also labelled P2_SS_RXB]
P2_SS_RX_P: D15.2(IO2) D15.9(NC) P7.6(RX+) U2.5(P2_SS_RXA)  [also labelled P2_SS_RXA]
P2_SS_TX_N: C21.2 U2.4(P2_SS_TXB)  [also labelled P2_SS_TXB]
P2_SS_TX_P: C23.2 U2.3(P2_SS_TXA)  [also labelled P2_SS_TXA]
P2C_N: C23.1 D15.5(IO4) D15.6(NC) P7.9(TX+)
P2C_P: C21.1 D15.4(IO3) D15.7(NC) P7.8(TX-)
P3_AS_DX_N: D16.6(IO4) P4.2(D-) U2.48(P3_HS_DM)  [also labelled P3_HS_DM]
P3_AS_DX_P: D16.1(IO1) P4.3(D+) U2.47(P3_HS_DP)  [also labelled P3_HS_DP]
P3_SS_RX_N: D17.2(IO2) D17.9(NC) P4.6(RX+) U2.45(P3_SS_RXB)  [also labelled P3_SS_RXB]
P3_SS_RX_P: D17.1(IO1) D17.10(NC) P4.5(RX-) U2.46(P3_SS_RXA)  [also labelled P3_SS_RXA]
P3_SS_TX_N: C37.2 U2.42(P3_SS_TXB)  [also labelled P3_SS_TXB]
P3_SS_TX_P: C35.2 U2.43(P3_SS_TXA)  [also labelled P3_SS_TXA]
P3C_N: C37.1 D17.5(IO4) D17.6(NC) P4.9(TX+)
P3C_P: C35.1 D17.4(IO3) D17.7(NC) P4.8(TX-)
P4_AS_DX_N: U2.41(P4_HS_DM) ; port P4_HS_Dx_N  [also labelled P4_HS_DM]
P4_AS_DX_P: U2.40(P4_HS_DP) ; port P4_HS_Dx_P  [also labelled P4_HS_DP]
P4_SS_RXA: U2.39(P4_SS_RXA)
P4_SS_RXB: U2.38(P4_SS_RXB)
P4_SS_TXA: U2.36(P4_SS_TXA)
P4_SS_TXB: U2.35(P4_SS_TXB)
PWR_CC/GPIO0/BC_EN#: R10.2 U2.13(PWR_CC/GPIO0/BC_EN#)
PWREN#: U2.11(PWREN#) U3.4(EN#) U5.4(EN#)
RESET#: C11.2 R5.1 U2.18(RESET#)
SMBCLK/SCL/EXCH#: P1.2 P8.1 U2.16(SMBCLK/SCL/EXCH#)
SMBDAT/SDA: P8.2 U2.17(SMBDAT/SDA)
SUSP/PDHUB#: LED2.2(K) U2.15(SUSP/PDHUB#)
UP_AS_DX_N: D4.6(IO4) P2.2(D-) U2.29(UP_HS_DM)  [also labelled UP_HS_DM]
UP_AS_DX_P: D4.1(IO1) P2.3(D+) U2.28(UP_HS_DP)  [also labelled UP_HS_DP]
UP_SS_RX_N: D5.2(IO2) D5.9(NC) P2.6(RX+) U2.33(UP_SS_RXB)  [also labelled UP_SS_RXB]
UP_SS_RX_P: D5.1(IO1) D5.10(NC) P2.5(RX-) U2.34(UP_SS_RXA)  [also labelled UP_SS_RXA]
UP_SS_TX_N: C13.2 U2.30(UP_SS_TXB)  [also labelled UP_SS_TXB]
UP_SS_TX_P: C12.2 U2.31(UP_SS_TXA)  [also labelled UP_SS_TXA]
UPC_N: C13.1 D5.5(IO4) D5.6(NC) P2.9(TX+)
UPC_P: C12.1 D5.4(IO3) D5.7(NC) P2.8(TX-)
VSW: L2.1 U2.10(VSW)
XI: C33.1 U2.20(XI) X1.1(XIN)
XO: C34.2 U2.19(XO) X1.3(XOUT)
NetLED1_1: LED1.1(A) R11.1
NetLED2_1: LED2.1(A) R12.1
NetP1_1: P1.1 R4.1
NetR6_1: R6.1 U3.5(ISET)
NetR8_1: R8.1 U5.5(ISET)

Not connected (* = marked no-connect by the designer): D4 3(IO2)* 4(IO3)*; D6 3(IO2)* 4(IO3)*; D14 3(IO2)* 4(IO3)*; D16 3(IO2)* 4(IO3)*

### Layout directives
differential pair: P1_AS_DX_N, P1_AS_DX_P, P1_SS_RX_N, P1_SS_RX_P, P1_SS_TX_N, P1_SS_TX_P, P1C_N, P1C_P, P2_AS_DX_N, P2_AS_DX_P, P2_SS_RX_N, P2_SS_RX_P, P2_SS_TX_N, P2_SS_TX_P, P2C_N, P2C_P, P3_AS_DX_N, P3_AS_DX_P, P3_SS_RX_N, P3_SS_RX_P, P3_SS_TX_N, P3_SS_TX_P, P3C_N, P3C_P, P4_AS_DX_N, P4_AS_DX_P, UP_AS_DX_N, UP_AS_DX_P, UP_SS_RX_N, UP_SS_RX_P, UP_SS_TX_N, UP_SS_TX_P, UPC_N, UPC_P

### Library data of the parts
C9 C29 = Cap: Capacitor; Published: 8-Jun-2000; LatestRevisionDate: 17-Jul-2002; LatestRevisionNote: Re-released for DXP Platform.; PackageReference: RAD-0.3; Publisher: Altium Limited; PackageDescription: Radial Cap, Thru-Hole; 2 Leads; 0.3 in Pin Spacing
C10-C13 C16#2 C17-C19 C20#2 C21 C22#2 C23-C28 C30-C38 C47-C50 = CAP: Capacitor
C51 = JBLE2471M016D090RLM 470UF 16V: as C46 on sheet Connect; Symbol: JBLE2471M016D090RLM 470UF 16V; Device: JBLE2471M016D090RLM 470UF 16V; Supplier Part: C19270650; Manufacturer Part: JBLE2471M016D090RLM 470UF 16V; JLCPCB Part Class: Extended Part; Datasheet: https://atta.szlcsc.com/upload/public/pdf/source/20240115/1E5B34C3EFC94403EAAAB66897201DA6.pdf; Supplier: LCSC; Convert to PCB: yes; Value: 470uF
D18 D20-D22 = SMAJ5.0CA_C83324: as D2 on sheet Power; Device: SMAJ5.0CA_C83324; Supplier Part: C83324; Manufacturer Part: SMAJ5.0CA; Supplier Footprint: SMA(DO-214AC); JLCPCB Part Class: Extended Part; Datasheet: https://atta.szlcsc.com/upload/public/pdf/source/20190402/C374025_5ACE77BC72947DF13CF0CBC7F8B57228.pdf; Supplier: LCSC; Convert to PCB: yes
L2 = Inductor: Code_IEC: 1005; Published: 8-Jun-2000; LatestRevisionDate: 29-May-2009; LatestRevisionNote: IPC-7351 Footprint Added.; PackageReference: 0402-A; Publisher: Altium Limited; PackageDescription: Chip Inductor; Code_JEITA: 0402
LED1 LED2 = LED
P1 = HEADER 2: Header, 2-Pin
P2 P3#2 P4 P6 P7 = USB-AF3.0-90卷
P8 = HEADER 5: Header, 5-Pin
R2#2 R3#2 R4-R12 = RES
U2 = CH634M: 4 ports USB 3.0 SS hub
U3 U5 = CH217K: Current-Limited USB Power Distribution Switch
U6 = CH213K: Ideal Diode 5V*1A
X1 = 晶体
D4 D6 D14 D16 = CH412K: Symbol: CH412K
D5 D7 D15 D17 = TPD4E02B04QDQARQ1: Symbol: TPD4E02B04QDQARQ1

## Nets that join several sheets
GND: Connect (34 pins), Power (53 pins), USBhub-CH634M-R0-1v1 (62 pins)
USB_5V: Connect (D19.1), Power (6 pins), USBhub-CH634M-R0-1v1 (U3.6 U5.6 U6.2)
VCC_3.3V: Connect (L3.1 L4.1 P10.9 P10.10), Power (7 pins)
VCC_5V: Connect (7 pins), Power (10 pins)
VIN5_12V: Connect (H2.1), Power (D3.2)
NetC76_1: Connect (P9.1), Power (5 pins)
NetD8_1: Connect (P10.19 P10.20), Power (D8.1 D9.1 F1.2)
NetP10_1: Connect (P10.1), Power (U18.1)
NetP10_2: Connect (P10.2), Power (U18.2)
NetP10_4: Connect (P10.4), Power (U18.3)
P4_AS_DX_N: Connect (R16.2 VD2.1), USBhub-CH634M-R0-1v1 (U2.41)
P4_AS_DX_P: Connect (R17.2 VD1.1), USBhub-CH634M-R0-1v1 (U2.40)